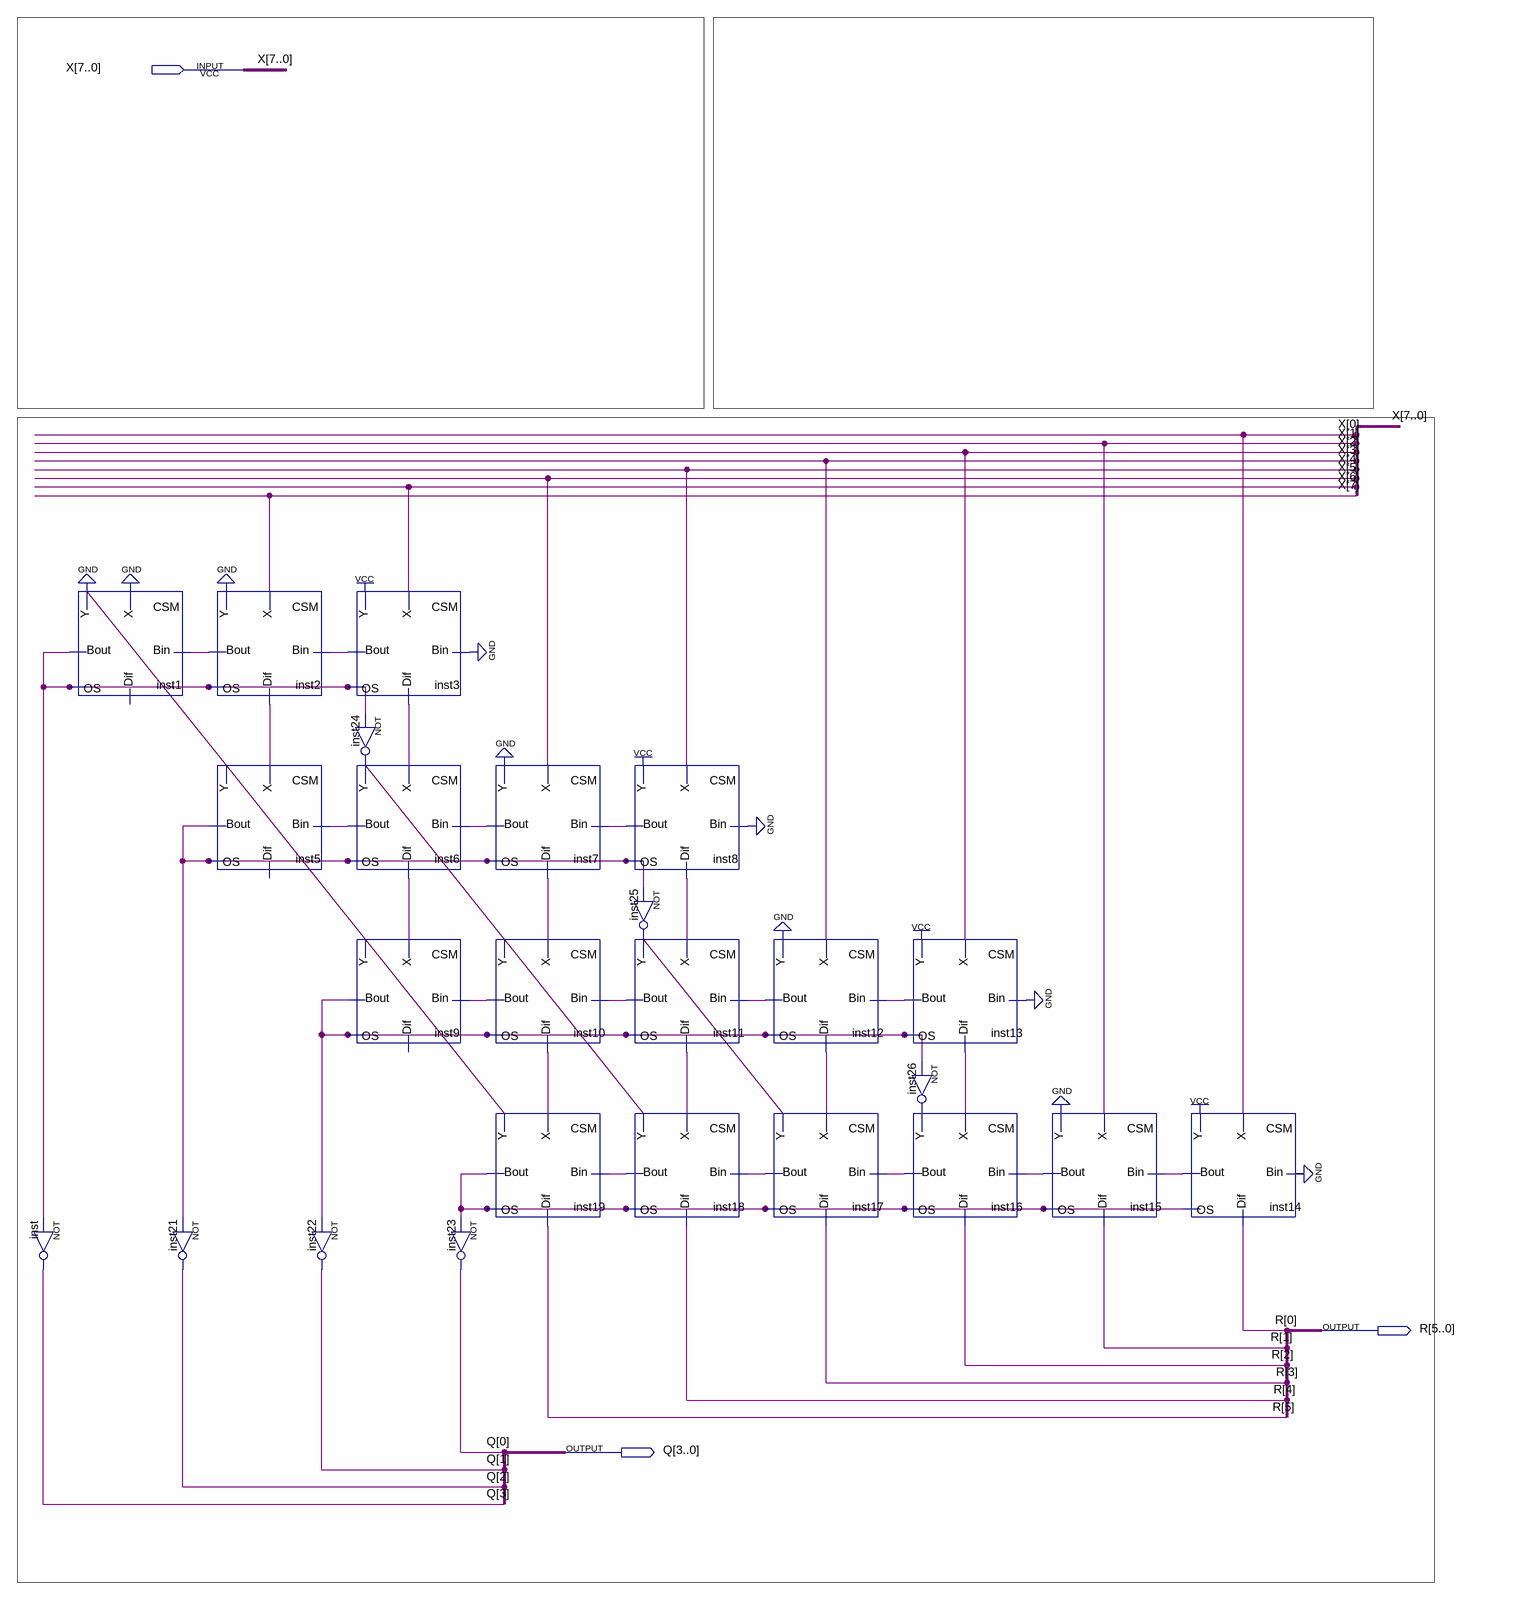
[diagram p0: schematic sheet]
// Quartus schematic aula-11.bdf as structural Verilog: 25 symbols, 3 pins
module \aula-11  (
  input  [7:0] X,
  output [5:0] R,
  output [3:0] Q
);

  wire inst1_bout, inst2_bout, inst2_dif, inst3_bout, inst3_dif, inst5_bout, inst6_bout, inst6_dif,
       inst7_bout, inst7_dif, inst8_bout, inst8_dif, inst9_bout, inst10_bout, inst10_dif, inst11_bout,
       inst11_dif, inst12_bout, inst12_dif, inst13_bout, inst13_dif, inst14_bout, inst15_bout, inst16_bout,
       inst17_bout, inst18_bout, inst19_bout, inst24_out, inst25_out, inst26_out;

  CSM inst1 (.Y(1'b0), .X(1'b0), .Bin(inst2_bout), .OS(inst1_bout), .Bout(inst1_bout));  // open: Dif
  not inst (Q[3], inst1_bout);
  CSM inst2 (.Y(1'b0), .X(X[7]), .Bin(inst3_bout), .OS(inst1_bout), .Bout(inst2_bout), .Dif(inst2_dif));
  CSM inst5 (.Y(1'b0), .X(inst2_dif), .Bin(inst6_bout), .OS(inst5_bout), .Bout(inst5_bout));  // open: Dif
  not inst21 (Q[2], inst5_bout);
  CSM inst3 (.Y(1'b1), .X(X[6]), .Bin(1'b0), .OS(inst1_bout), .Bout(inst3_bout), .Dif(inst3_dif));
  not inst24 (inst24_out, inst1_bout);
  CSM inst6 (.Y(inst24_out), .X(inst3_dif), .Bin(inst7_bout), .OS(inst5_bout), .Bout(inst6_bout), .Dif(inst6_dif));
  CSM inst9 (.Y(1'b0), .X(inst6_dif), .Bin(inst10_bout), .OS(inst9_bout), .Bout(inst9_bout));  // open: Dif
  not inst22 (Q[1], inst9_bout);
  CSM inst7 (.Y(1'b0), .X(X[5]), .Bin(inst8_bout), .OS(inst5_bout), .Bout(inst7_bout), .Dif(inst7_dif));
  CSM inst10 (.Y(inst24_out), .X(inst7_dif), .Bin(inst11_bout), .OS(inst9_bout), .Bout(inst10_bout), .Dif(inst10_dif));
  CSM inst19 (.Y(1'b0), .X(inst10_dif), .Bin(inst18_bout), .OS(inst19_bout), .Bout(inst19_bout), .Dif(R[5]));
  not inst23 (Q[0], inst19_bout);
  CSM inst8 (.Y(1'b1), .X(X[4]), .Bin(1'b0), .OS(inst5_bout), .Bout(inst8_bout), .Dif(inst8_dif));
  not inst25 (inst25_out, inst5_bout);
  CSM inst11 (.Y(inst25_out), .X(inst8_dif), .Bin(inst12_bout), .OS(inst9_bout), .Bout(inst11_bout), .Dif(inst11_dif));
  CSM inst18 (.Y(inst24_out), .X(inst11_dif), .Bin(inst17_bout), .OS(inst19_bout), .Bout(inst18_bout), .Dif(R[4]));
  CSM inst12 (.Y(1'b0), .X(X[3]), .Bin(inst13_bout), .OS(inst9_bout), .Bout(inst12_bout), .Dif(inst12_dif));
  CSM inst17 (.Y(inst25_out), .X(inst12_dif), .Bin(inst16_bout), .OS(inst19_bout), .Bout(inst17_bout), .Dif(R[3]));
  CSM inst13 (.Y(1'b1), .X(X[2]), .Bin(1'b0), .OS(inst9_bout), .Bout(inst13_bout), .Dif(inst13_dif));
  not inst26 (inst26_out, inst9_bout);
  CSM inst16 (.Y(inst26_out), .X(inst13_dif), .Bin(inst15_bout), .OS(inst19_bout), .Bout(inst16_bout), .Dif(R[2]));
  CSM inst15 (.Y(1'b0), .X(X[1]), .Bin(inst14_bout), .OS(inst19_bout), .Bout(inst15_bout), .Dif(R[1]));
  CSM inst14 (.Y(1'b1), .X(X[0]), .Bin(1'b0), .OS(inst19_bout), .Bout(inst14_bout), .Dif(R[0]));
endmodule
